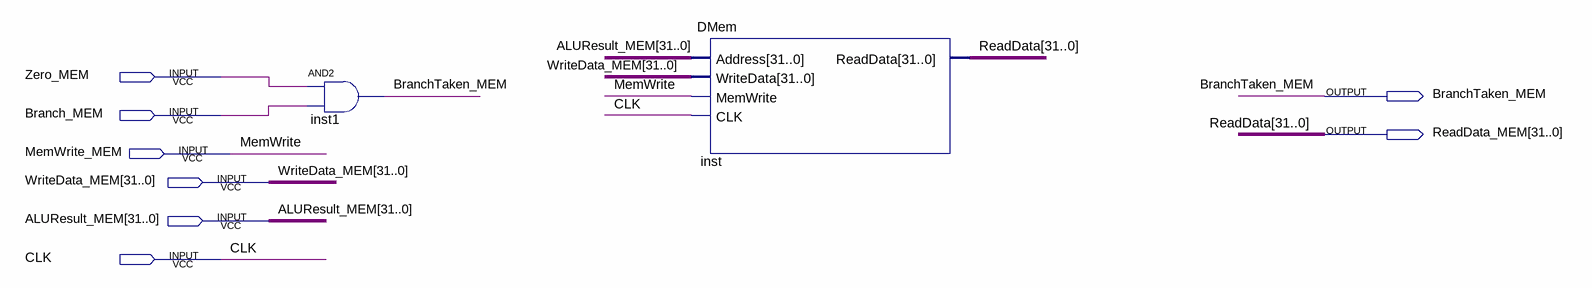
[diagram p0: schematic sheet]
// Quartus schematic MEM_Stage.bdf as structural Verilog: 2 symbols, 8 pins
module MEM_Stage (
  input  Zero_MEM,
  input  Branch_MEM,
  input  MemWrite_MEM,
  input  [31:0] WriteData_MEM,
  input  [31:0] ALUResult_MEM,
  input  CLK,
  output BranchTaken_MEM,
  output [31:0] ReadData_MEM
);

  and inst1 (BranchTaken_MEM, Zero_MEM, Branch_MEM);
  DMem inst (
    .Address(ALUResult_MEM), .WriteData(WriteData_MEM), .MemWrite(MemWrite_MEM), .CLK(CLK),
    .ReadData(ReadData_MEM));

  // Other names for the same wires on the sheet: MemWrite = MemWrite_MEM; ReadData[31:0] = ReadData_MEM
endmodule
